# EAGLE design Contoller Circuit (final) (EAGLE 9.6.2)
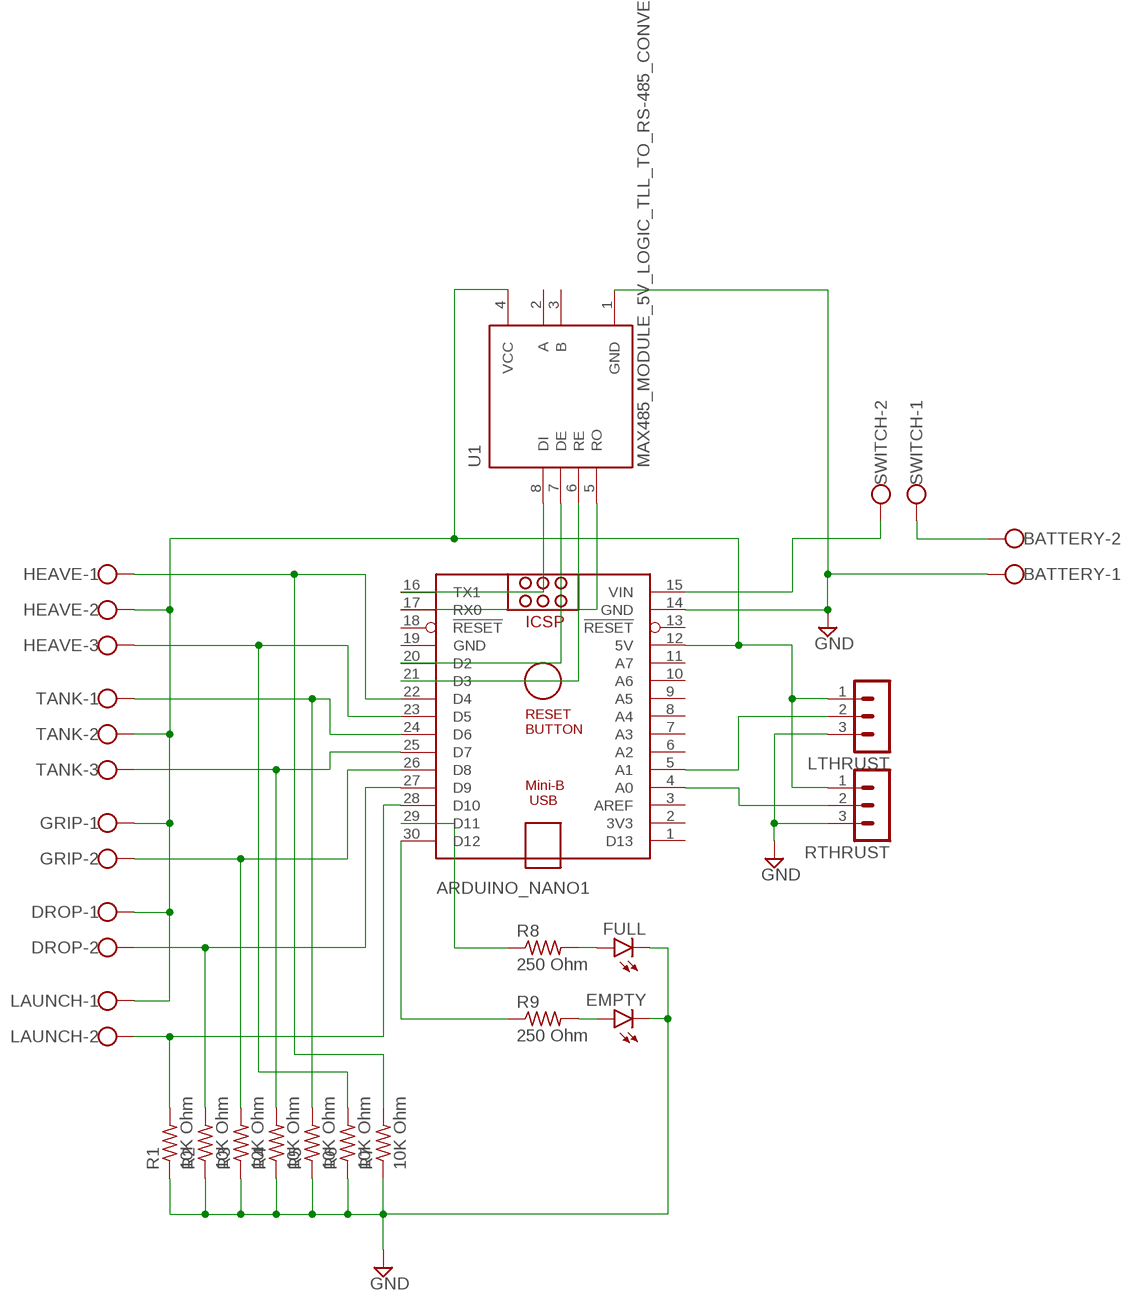
[diagram p0: schematic, sheet 1]

## Parts
ARDUINO_NANO1  ARDUINO_NANO  [ARDUINO_NANO]
BATTERY  W237-102  [W237-102]
DROP  W237-102  [W237-102]
EMPTY  LED3MM  [LED3MM]
FULL  LED3MM  [LED3MM]
GRIP  W237-102  [W237-102]
HEAVE  W237-103  [W237-103]
LAUNCH  W237-102  [W237-102]
LTHRUST  MA03-1  [MA03-1]
R1  10K Ohm  R-US_0204/7  [0204/7]
R2  10K Ohm  R-US_0204/7  [0204/7]
R3  10K Ohm  R-US_0204/7  [0204/7]
R4  10K Ohm  R-US_0204/7  [0204/7]
R5  10K Ohm  R-US_0204/7  [0204/7]
R6  10K Ohm  R-US_0204/7  [0204/7]
R7  10K Ohm  R-US_0204/7  [0204/7]
R8  250 Ohm  R-US_0204/7  [0204/7]
R9  250 Ohm  R-US_0204/7  [0204/7]
RTHRUST  MA03-1  [MA03-1]
SWITCH  W237-102  [W237-102]
TANK  W237-103  [W237-103]
U1  MAX485_MODULE_5V_LOGIC_TLL_TO_RS-485_CONVERTER  [MODULE_MAX485_MODULE_5V_LOGIC_TLL_TO_RS-485_CONVERTER]

## Nets
GND: ARDUINO_NANO1.14(GND) BATTERY.1 EMPTY.K(C) FULL.K(C) LTHRUST.3 R1.1 R2.1 R3.1 R4.1 R5.1 R6.1 R7.1 RTHRUST.3 U1.1(GND)
N$1: ARDUINO_NANO1.12(5V) DROP.1 GRIP.1 HEAVE.2 LAUNCH.1 LTHRUST.1 RTHRUST.1 TANK.2 U1.4(VCC)
N$2: ARDUINO_NANO1.4(A0) RTHRUST.2
N$3: ARDUINO_NANO1.20(D2) U1.7(DE)
N$4: ARDUINO_NANO1.21(D3) U1.6(RE)
N$5: FULL.A R8.2
N$6: ARDUINO_NANO1.22(D4) HEAVE.1 R7.2
N$7: ARDUINO_NANO1.5(A1) LTHRUST.2
N$8: ARDUINO_NANO1.15(VIN) SWITCH.2
N$9: ARDUINO_NANO1.23(D5) HEAVE.3 R6.2
N$10: ARDUINO_NANO1.24(D6) R5.2 TANK.1
N$11: ARDUINO_NANO1.25(D7) R4.2 TANK.3
N$12: ARDUINO_NANO1.16(TX1) U1.8(DI)
N$13: ARDUINO_NANO1.17(RX0) U1.5(RO)
N$14: ARDUINO_NANO1.26(D8) GRIP.2 R3.2
N$15: ARDUINO_NANO1.27(D9) DROP.2 R2.2
N$16: ARDUINO_NANO1.28(D10) LAUNCH.2 R1.2
N$17: ARDUINO_NANO1.29(D11) R8.1
N$18: ARDUINO_NANO1.30(D12) R9.1
N$19: EMPTY.A R9.2
N$20: BATTERY.2 SWITCH.1
Unconnected: ARDUINO_NANO1.1(D13) ARDUINO_NANO1.2(3V3) ARDUINO_NANO1.3(AREF) ARDUINO_NANO1.6(A2) ARDUINO_NANO1.7(A3) ARDUINO_NANO1.8(A4) ARDUINO_NANO1.9(A5) ARDUINO_NANO1.10(A6) ARDUINO_NANO1.11(A7) ARDUINO_NANO1.13(!RESET) ARDUINO_NANO1.18(!RESET) U1.2(A) U1.3(B)

## Power pins joined to a net without a drawn wire
GND: ARDUINO_NANO1.19(GND)

## Library data of the parts
ARDUINO_NANO1 = ArduinoNanoV30:ARDUINO_NANO: Arduino Nano V3.0 Overview: The Arduino Nano is a small, complete, and breadboard-friendly board based on the ATmega328 (Arduino Nano 3.x) or ATmega168 (Arduino Nano 2.x). It has more or less the same functionality of the Arduino Duemilanove, but in a different package. It lacks only a DC power jack, and works with a Mini-B USB cable instead of a standard one. The Nano was designed and is being produced by Gravitech. Specifications: Microcontroller Atmel ATmega168 or ATmega328 Operating Voltage (logic level) 5 V Input Voltage (recommended) 7-12 V Input Voltage (limits) 6-20 V Digital I/O Pins 14 (of which 6 provide PWM output) Analog Input Pins 8 DC Current per I/O Pin 40 mA Flash Memory 16 KB (ATmega168) or 32 KB (ATmega328) of which 2 KB used by bootloader SRAM 1 KB (ATmega168) or 2 KB (ATmega328) EEPROM 512 bytes (ATmega168) or 1 KB (ATmega328) Clock Speed 16 MHz Dimensions 0.73" x 1.70" Length 45 mm Width 18 mm Weigth 5 g Power: The Arduino Nano can be powered via the Mini-B USB connection, 6-20V unregulated external power supply (pin 30), or 5V regulated external power supply (pin 27). The power source is automatically selected to the highest voltage source. Memory: The ATmega168 has 16 KB of flash memory for storing code (of which 2 KB is used for the bootloader); the ATmega328 has 32 KB, (also with 2 KB used for the bootloader). The ATmega168 has 1 KB of SRAM and 512 bytes of EEPROM (which can be read and written with the EEPROM library); the ATmega328 has 2 KB of SRAM and 1 KB of EEPROM. Input and Output: Each of the 14 digital pins on the Nano can be used as an input or output, using pinMode(), digitalWrite(), and digitalRead() functions. They operate at 5 volts. Each pin can provide or receive a maximum of 40 mA and has an internal pull-up resistor (disconnected by default) of 20-50 kOhms. In addition, some pins have specialized functions. Visit Arduino - ArduinoBoardNano <https://www.arduino.cc/en/Main/ArduinoBoardNano>
BATTERY DROP GRIP LAUNCH SWITCH = con-wago-500:W237-102: WAGO SCREW CLAMP; MPN: 237-102; OC_FARNELL: unknown; OC_NEWARK: 70K9898
EMPTY FULL = led:LED: LED OSRAM: - CHIPLED LG R971, LG N971, LY N971, LG Q971, LY Q971, LO R971, LY R971 LH N974, LH R974 LS Q976, LO Q976, LY Q976 LO Q996 - Hyper CHIPLED LW Q18S LB Q993, LB Q99A, LB R99A - SideLED LS A670, LO A670, LY A670, LG A670, LP A670 LB A673, LV A673, LT A673, LW A673 LH A674 LY A675 LS A676, LA A676, LO A676, LY A676, LW A676 LS A679, LY A679, LG A679 - Hyper Micro SIDELED® LS Y876, LA Y876, LO Y876, LY Y876 LT Y87S - SmartLED LW L88C, LW L88S LB L89C, LB L89S, LG L890 LS L89K, LO L89K, LY L89K LS L896, LA L896, LO L896, LY L896 - TOPLED LS T670, LO T670, LY T670, LG T670, LP T670 LSG T670, LSP T670, LSY T670, LOP T670, LYG T670 LG T671, LOG T671, LSG T671 LB T673, LV T673, LT T673, LW T673 LH T674 LS T676, LA T676, LO T676, LY T676, LB T676, LH T676, LSB T676, LW T676 LB T67C, LV T67C, LT T67C, LS T67K, LO T67K, LY T67K, LW E67C LS E67B, LA E67B, LO E67B, LY E67B, LB E67C, LV E67C, LT E67C LW T67C LS T679, LY T679, LG T679 LS T770, LO T770, LY T770, LG T770, LP T770 LB T773, LV T773, LT T773, LW T773 LH T774 LS E675, LA E675, LY E675, LS T675 LS T776, LA T776, LO T776, LY T776, LB T776 LHGB T686 LT T68C, LB T68C - Hyper Mini TOPLED® LB M676 - Mini TOPLED Santana® LG M470 LS M47K, LO M47K, LY M47K Source: http://www.osram.convergy.de LUXEON: - LUMILED® LXK2-PW12-R00, LXK2-PW12-S00, LXK2-PW14-U00, LXK2-PW14-V00 LXK2-PM12-R00, LXK2-PM12-S00, LXK2-PM14-U00 LXK2-PE12-Q00, LXK2-PE12-R00, LXK2-PE12-S00, LXK2-PE14-T00, LXK2-PE14-U00 LXK2-PB12-K00, LXK2-PB12-L00, LXK2-PB12-M00, LXK2-PB14-N00, LXK2-PB14-P00, LXK2-PB14-Q00 LXK2-PR12-L00, LXK2-PR12-M00, LXK2-PR14-Q00, LXK2-PR14-R00 LXK2-PD12-Q00, LXK2-PD12-R00, LXK2-PD12-S00 LXK2-PH12-R00, LXK2-PH12-S00 LXK2-PL12-P00, LXK2-PL12-Q00, LXK2-PL12-R00 Source: www.luxeon.com KINGBRIGHT: KA-3528ASYC Source: www.kingbright.com
HEAVE TANK = con-wago-500:W237-103: WAGO SCREW CLAMP; MPN: 237-103; OC_FARNELL: unknown; OC_NEWARK: 18M7116
LTHRUST RTHRUST = con-lstb:MA03-1: PIN HEADER; OC_FARNELL: unknown; OC_NEWARK: unknown
R1-R9 = rcl:R-US_: RESISTOR, American symbol; SPICEPREFIX: R
U1 = MAX485_MODULE_5V_LOGIC_TLL_TO_RS-485_CONVERTER:MAX485_MODULE_5V_LOGIC_TLL_TO_RS-485_CONVERTER: Check availability <https://pricing.snapeda.com/parts/MAX485%20Module%205V%20logic%20TLL%20to%20RS-485%20converter/e-Gizmo%20Mechatronix%20Central/view-part?ref=eda>; AVAILABILITY: Not in stock; DESCRIPTION: 5V MAX485 TTL To RS485 Converter Module Board for Arduino; MF: e-Gizmo Mechatronix Central; MP: MAX485 Module 5V logic TLL to RS-485 converter; PACKAGE: Package; PRICE: None

## Board
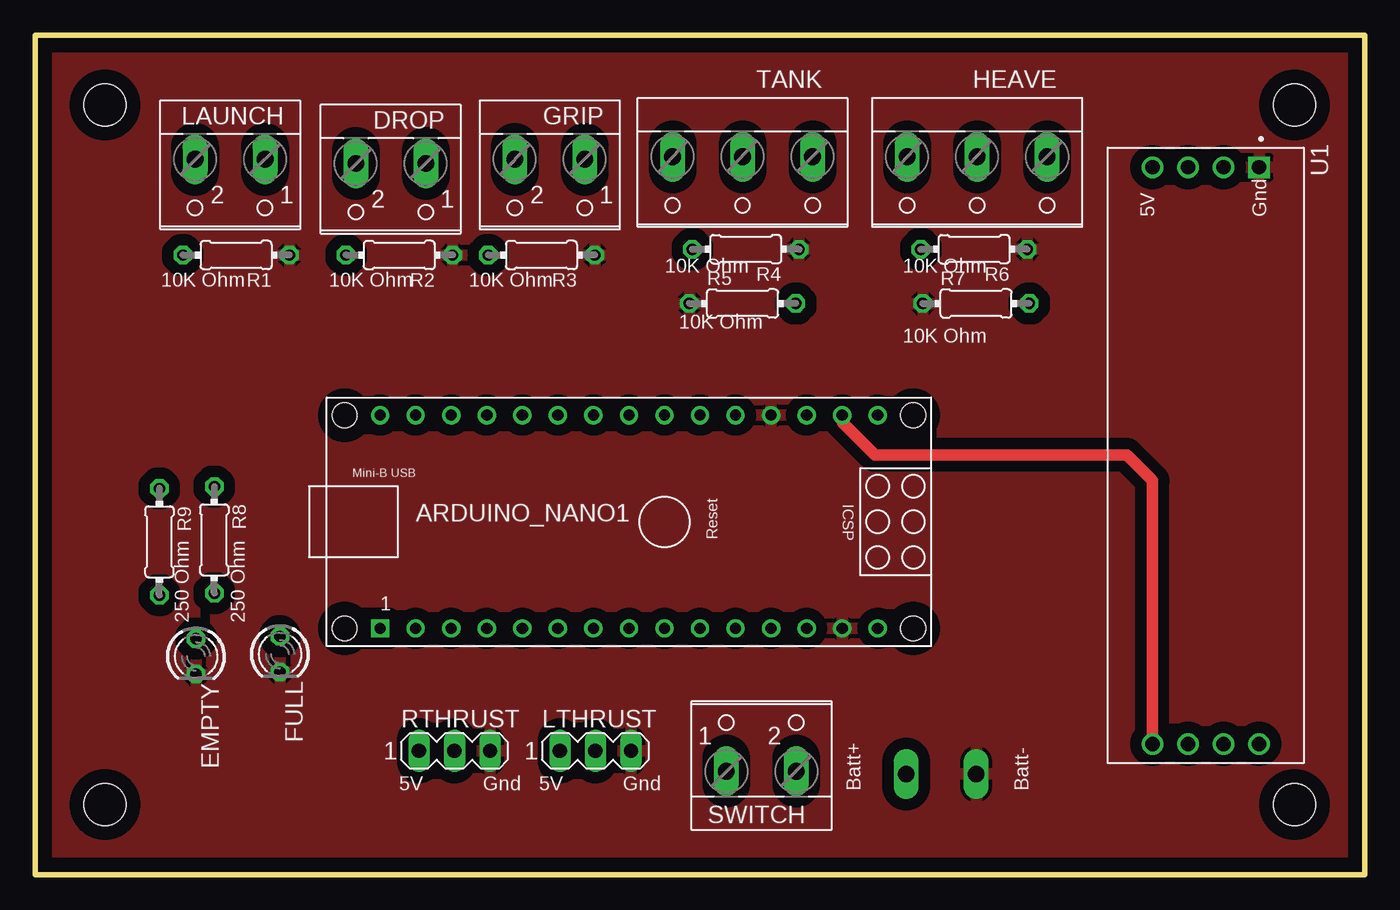
[diagram p1: board, top side]
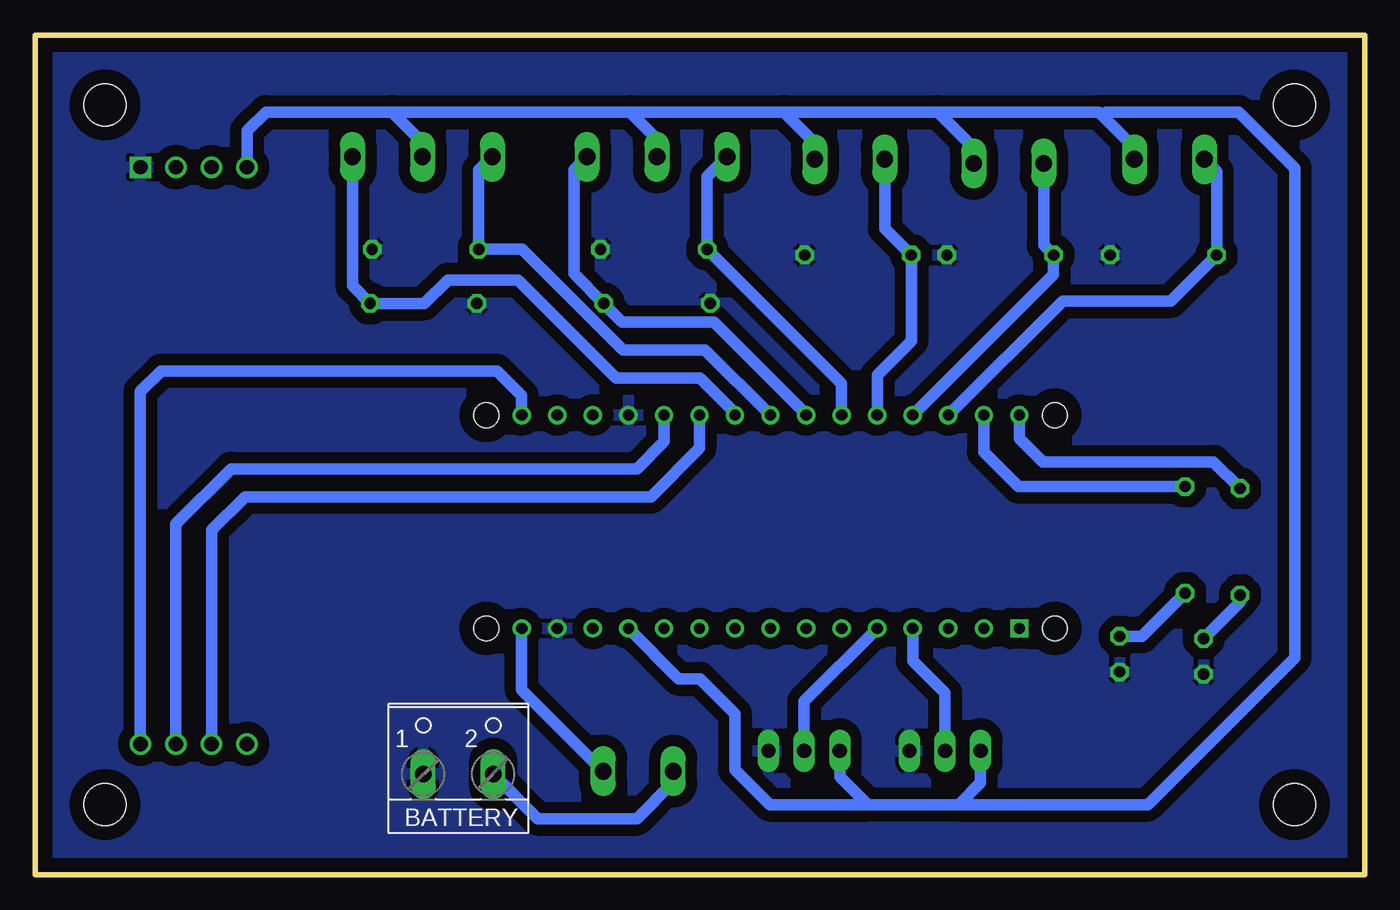
[diagram p2: board, bottom side, seen from below]

Size 95 x 60 mm. Coordinates in mm from the lower left corner, seen from the top.
Outline: 95,0 0,0 0,60 95,60 95,0
Copper layers (1*16): Top 0.035mm / dielectric 1.5mm / Bottom 0.035mm
Design rules "default": minimum track width 6mil, minimum drill 0.35mm, track to track 6mil, track to pad 6mil, pad to pad 6mil, via to via 6mil, smd to smd 6mil, copper to edge 40mil, drill to drill 6mil, minimum pad ring 10mil, minimum via ring 8mil, stop-mask expansion 4mil, vias tented up to drill 0mil, thermal gap 10mil
Holes 3 mm at 5,55 90,55 5,5 90,5

### Footprints (pad centres in the part's own frame; a part is rotated, then mirrored left to right if it is on the bottom)
ARDUINO_NANO = drill 0.8 square: 1 -20.32,-7.62 | drill 0.8: 2 -17.78,-7.62; 3 -15.24,-7.62; 4 -12.7,-7.62; 5 -10.16,-7.62; 6 -7.62,-7.62; 7 -5.08,-7.62; 8 -2.54,-7.62; 9 0,-7.62; 10 2.54,-7.62; 11 5.08,-7.62; 12 7.62,-7.62; 13 10.16,-7.62; 14 12.7,-7.62; 15 15.24,-7.62; 16 15.24,7.62; 17 12.7,7.62; 18 10.16,7.62; 19 7.62,7.62; 20 5.08,7.62; 21 2.54,7.62; 22 0,7.62; 23 -2.54,7.62; 24 -5.08,7.62; 25 -7.62,7.62; 26 -10.16,7.62; 27 -12.7,7.62; 28 -15.24,7.62; 29 -17.78,7.62; 30 -20.32,7.62 | hole 1.778: -22.86,-7.62; -22.86,7.62; 17.78,7.62; 17.78,-7.62
W237-102 = drill 1.194 long: 1 -2.5,-1.27; 2 2.5,-1.27
LED3MM = drill 0.813 octagon: A -1.27,0; K 1.27,0
W237-103 = drill 1.194 long: 1 -5,-1.29; 2 0,-1.29; 3 5,-1.29
MA03-1 = drill 1.016 long: 1 -2.54,0; 2 0,0; 3 2.54,0
0204/7 = drill 0.813 octagon: 1 -3.81,0; 2 3.81,0
MODULE_MAX485_MODULE_5V_LOGIC_TLL_TO_RS-485_CONVERTER = drill 1.02 square: 1 -20.6,3.81 | drill 1.02: 2 -20.6,1.27; 3 -20.6,-1.27; 4 -20.6,-3.81; 5 20.62,-3.81; 6 20.62,-1.27; 7 20.62,1.27; 8 20.62,3.81

### Placement (x,y rotation side)
ARDUINO_NANO1  44.98,25.21 0 top
BATTERY  64.76,8.45 0 bottom
DROP  25.42,49.55 180 top
EMPTY  11.5,15.59 270 top
FULL  17.5,15.75 270 top
GRIP  36.78,49.85 180 top
HEAVE  67.32,50.01 180 top
LAUNCH  13.94,49.85 180 top
LTHRUST  40.04,8.84 0 top
R1  14.37,44.27 180 top
R2  26.03,44.27 180 top
R3  36.19,44.27 180 top
R4  50.78,44.69 180 top
R5  50.56,40.81 0 top
R6  67.1,44.69 180 top
R7  67.24,40.81 0 top
R8  12.81,23.92 270 top
R9  8.89,23.78 270 top
RTHRUST  29.97,8.84 0 top
SWITCH  51.9,8.65 0 top
TANK  50.56,50.01 180 top
U1  83.66,29.95 270 top

### Tracks (layer width: path | path; a pad name or v marks a point on that pad's centre or on a via)
GND
  pour Top (isolate 0.813): 0,60 0,0 95,0 95,60
  pour Bottom (isolate 0.813): 0,60 95,60 95,0 0,0
N$1
  Bottom 0.813: RTHRUST.1 27.43,6.57 29,5 | LTHRUST.1 37.5,7 35.5,5 | 29,5 35.5,5 | ARDUINO_NANO1.12 49.01,14 47.5,14 45,11.5 45,7.5 42.5,5 35.5,5 | 69.5,54.5 52.5,54.5 | 52.5,54.5 41.5,54.5 | 41.5,54.5 30.5,54.5 | 30.5,54.5 19,54.5 18.75,54.25 | 18.75,54.25 16.44,51.94 LAUNCH.1 | DROP.1 27.92,51.92 30.5,54.5 | GRIP.1 39.28,52.28 41.5,54.5 | TANK.2 50.56,52.56 52.5,54.5 | HEAVE.2 67.32,52.32 69.5,54.5 | 29,5 15.5,5 5,15.5 5,50.5 9,54.5 18.5,54.5 18.75,54.25 | 69.5,54.5 78.5,54.5 79.85,53.15 U1.4
N$2
  Bottom 0.813: ARDUINO_NANO1.4 32.28,15.28 29.97,12.97 RTHRUST.2
N$3
  Bottom 0.813: ARDUINO_NANO1.20 50.06,30.94 52,29 81,29 84.93,25.07 U1.7
N$4
  Bottom 0.813: ARDUINO_NANO1.21 47.52,30.48 51,27 80,27 82.39,24.61 U1.6
N$5
  Bottom 0.813: R8.2 15.9,17.02 FULL.A
N$6
  Bottom 0.813: HEAVE.1 72.32,42.08 R7.2 67.19,40.81 65.5,42.5 60.5,42.5 53.5,35.5 47.5,35.5 44.98,32.98 ARDUINO_NANO1.22
N$7
  Bottom 0.813: ARDUINO_NANO1.5 40.04,12.37 LTHRUST.2
N$8
  Bottom 0.813: SWITCH.2 60.22,13.2 ARDUINO_NANO1.15
N$9
  Bottom 0.813: HEAVE.3 63.29,50.33 R6.2 60.19,44.69 53,37.5 47.11,37.5 ARDUINO_NANO1.23
N$10
  Bottom 0.813: TANK.1 56.5,50.36 56.5,42.94 R5.2 53.06,39.5 46.5,39.5 39.9,32.9 ARDUINO_NANO1.24
N$11
  Bottom 0.813: ARDUINO_NANO1.25 37.36,35.08 R4.2 46.97,49.89 TANK.3
N$12
  Bottom 0.813: ARDUINO_NANO1.16 60.22,34.22 62,36 86,36 87.47,34.53 U1.8
N$13
  Top 0.813: U1.5 79.85,28.15 78,30 60,30 57.68,32.32 ARDUINO_NANO1.17
N$14
  Bottom 0.813: GRIP.2 34.28,46.17 R3.2 32.38,38.12 34.82,35.68 ARDUINO_NANO1.26
N$15
  Bottom 0.813: DROP.2 22.92,44.97 R2.2 22.22,42.89 ARDUINO_NANO1.27
N$16
  Bottom 0.813: ARDUINO_NANO1.28 21.57,41 13.83,41 R1.2 10.56,50.24 LAUNCH.2
N$17
  Bottom 0.813: ARDUINO_NANO1.29 27.2,30.2 24.73,27.73 R8.1
N$18
  Bottom 0.813: ARDUINO_NANO1.30 24.66,31.16 23,29.5 10.8,29.5 R9.1
N$19
  Bottom 0.813: R9.2 8.89,19.47 EMPTY.A
N$20
  Bottom 0.813: BATTERY.2 59.08,4 52,4 49.4,6.6 SWITCH.1

### Text on the board
tNames: 5V | Gnd | 10K Ohm | 10K Ohm | 10K Ohm | 10K Ohm | 10K Ohm | 10K Ohm | 10K Ohm | 250 Ohm | 250 Ohm | 5V | Gnd | 5V | Gnd | Batt+ | Batt-